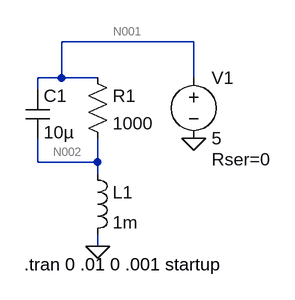
[diagram p0: schematic relayDrive.asc]
relayDrive.asc, the LTspice schematic file:
Version 4
SHEET 1 880 680
WIRE 368 -64 192 -64
WIRE 192 -16 192 -64
WIRE 192 -16 160 -16
WIRE 240 -16 192 -16
WIRE 368 -16 368 -64
WIRE 160 0 160 -16
WIRE 160 96 160 64
WIRE 240 96 240 64
WIRE 240 96 160 96
WIRE 240 112 240 96
WIRE 240 208 240 192
FLAG 240 208 0
FLAG 368 64 0
SYMBOL ind 224 96 R0
SYMATTR InstName L1
SYMATTR Value 1m
SYMATTR SpiceLine Rser=250
SYMBOL res 224 -32 R0
SYMATTR InstName R1
SYMATTR Value 1000
SYMBOL cap 144 0 R0
SYMATTR InstName C1
SYMATTR Value 10µ
SYMBOL voltage 368 -32 R0
WINDOW 123 0 0 Left 0
WINDOW 39 24 124 Left 2
SYMATTR InstName V1
SYMATTR Value 5
SYMATTR SpiceLine Rser=0
TEXT 142 232 Left 2 !.tran 0 .01 0 .001 startup

The netlist it stands for:
* relayDrive.asc
L1 N002 0 1m Rser=250
R1 N001 N002 1000
C1 N001 N002 10µ
V1 N001 0 5 Rser=0
.tran 0 .01 0 .001 startup
.backanno
.end

* Results of the author's LTspice run, read from the files saved beside the schematic
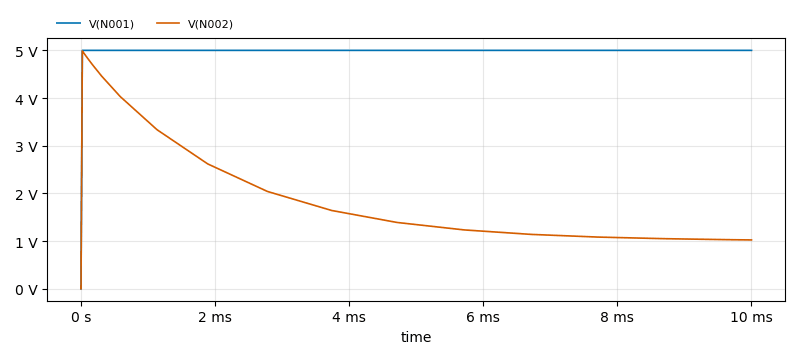
[diagram p1: Transient Analysis of relayDrive.asc, plotted from the saved traces]
* Transient Analysis, 1 run:
*   V(N001): min 0 V, max 5 V, average 4.995 V, rms 4.997 V, last 5 V
*   V(N002): min 0 V, max 4.986 V, average 1.819 V, rms 2.08 V, last 1.025 V